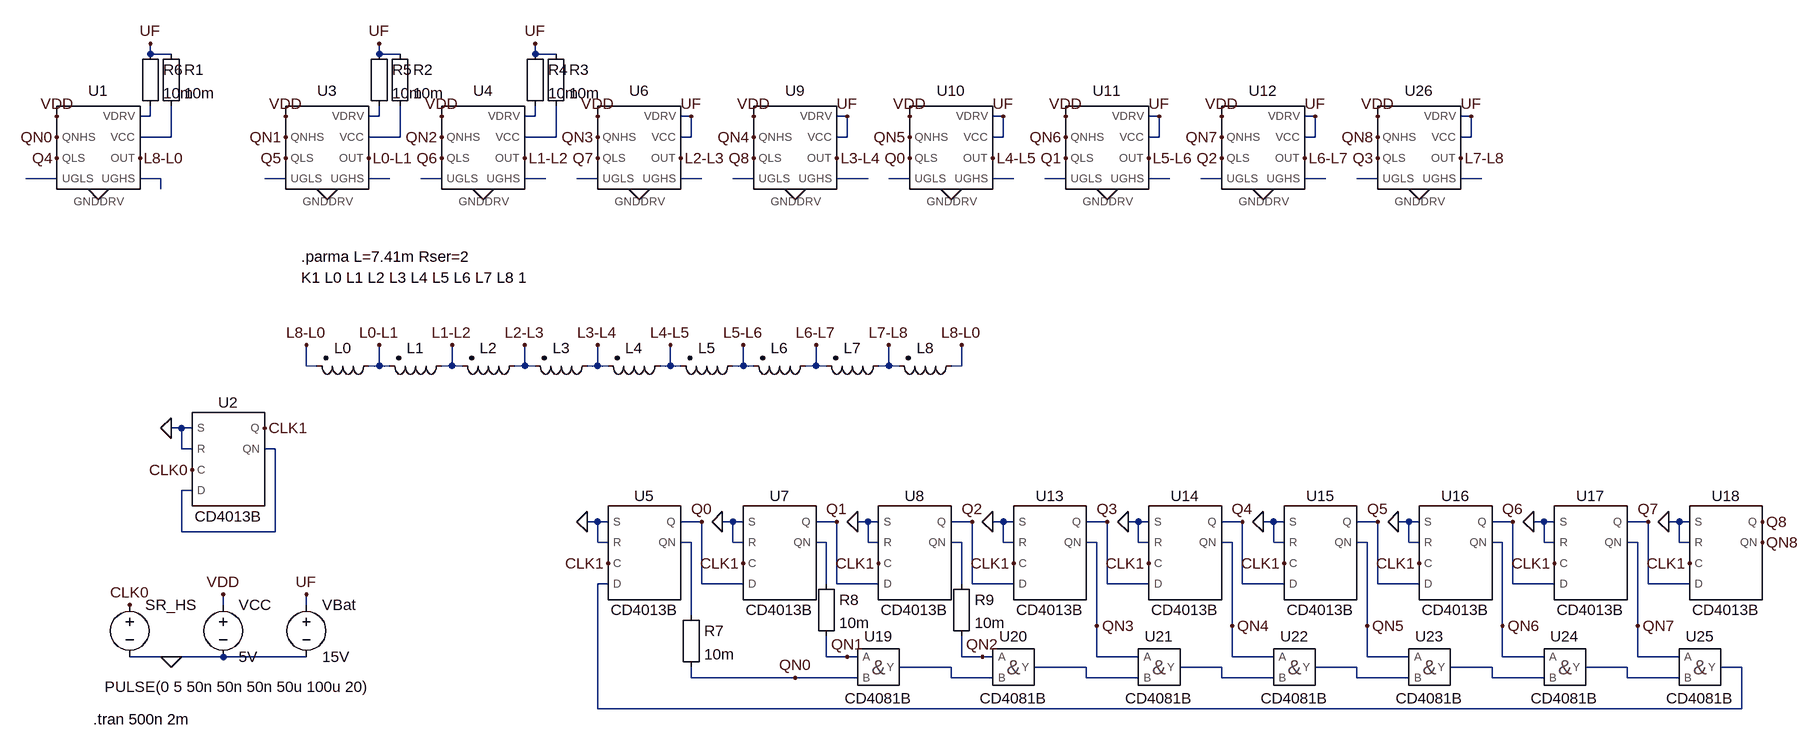
[diagram p0: schematic MosFetDriverDelayedOffPChannelDFF.asc]
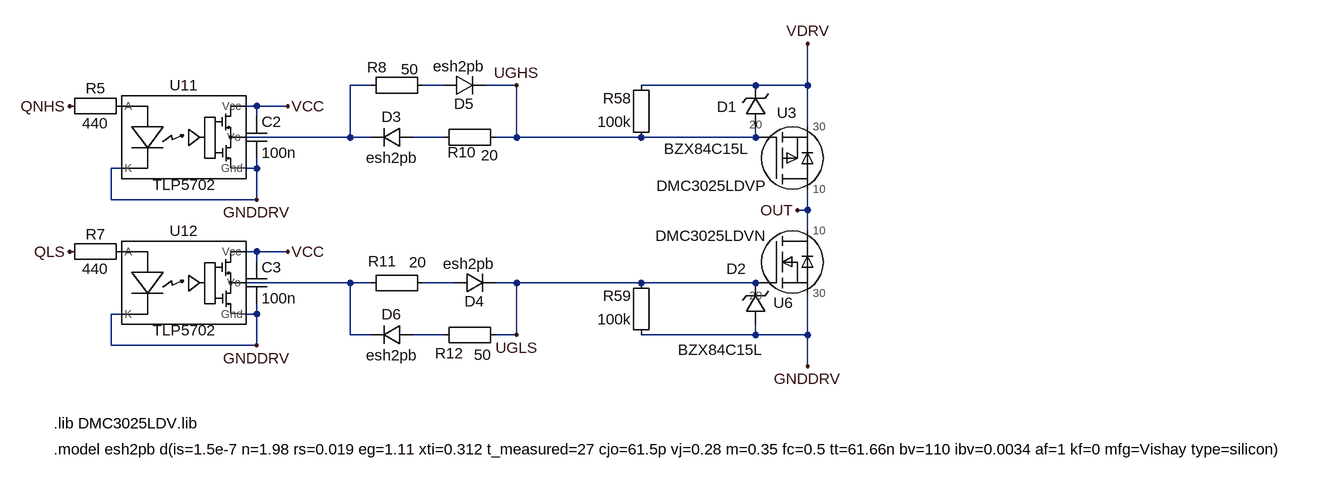
[diagram p1: sub-circuit mosfetdriverblock.asc]
MosFetDriverDelayedOffPChannelDFF.asc, the LTspice schematic file:
Version 4
SHEET 1 3880 2224
WIRE -1856 -160 -1856 -176
WIRE -1824 -160 -1856 -160
WIRE -1504 -160 -1504 -176
WIRE -1472 -160 -1504 -160
WIRE -1264 -160 -1264 -176
WIRE -1232 -160 -1264 -160
WIRE -1856 -64 -1856 -80
WIRE -1856 -64 -1872 -64
WIRE -1504 -64 -1504 -80
WIRE -1504 -64 -1520 -64
WIRE -1264 -64 -1264 -80
WIRE -1264 -64 -1280 -64
WIRE -1024 -64 -1040 -64
WIRE -784 -64 -800 -64
WIRE -544 -64 -560 -64
WIRE -304 -64 -320 -64
WIRE -64 -64 -80 -64
WIRE 176 -64 160 -64
WIRE -1824 -32 -1824 -80
WIRE -1824 -32 -1872 -32
WIRE -1472 -32 -1472 -80
WIRE -1472 -32 -1520 -32
WIRE -1232 -32 -1232 -80
WIRE -1232 -32 -1280 -32
WIRE -1024 -32 -1024 -64
WIRE -1024 -32 -1040 -32
WIRE -784 -32 -784 -64
WIRE -784 -32 -800 -32
WIRE -544 -32 -544 -64
WIRE -544 -32 -560 -32
WIRE -304 -32 -304 -64
WIRE -304 -32 -320 -32
WIRE -64 -32 -64 -64
WIRE -64 -32 -80 -32
WIRE 176 -32 176 -64
WIRE 176 -32 160 -32
WIRE -2000 32 -2048 32
WIRE -1840 32 -1872 32
WIRE -1648 32 -1680 32
WIRE -1488 32 -1520 32
WIRE -1408 32 -1440 32
WIRE -1248 32 -1280 32
WIRE -1168 32 -1200 32
WIRE -1008 32 -1040 32
WIRE -928 32 -960 32
WIRE -752 32 -800 32
WIRE -688 32 -720 32
WIRE -528 32 -560 32
WIRE -448 32 -480 32
WIRE -288 32 -320 32
WIRE -208 32 -240 32
WIRE -48 32 -80 32
WIRE 32 32 0 32
WIRE 192 32 160 32
WIRE -1840 48 -1840 32
WIRE -1616 320 -1616 288
WIRE -1600 320 -1616 320
WIRE -1504 320 -1504 288
WIRE -1504 320 -1520 320
WIRE -1488 320 -1504 320
WIRE -1392 320 -1392 288
WIRE -1392 320 -1408 320
WIRE -1376 320 -1392 320
WIRE -1280 320 -1280 288
WIRE -1280 320 -1296 320
WIRE -1264 320 -1280 320
WIRE -1168 320 -1168 288
WIRE -1168 320 -1184 320
WIRE -1152 320 -1168 320
WIRE -1056 320 -1056 288
WIRE -1056 320 -1072 320
WIRE -1040 320 -1056 320
WIRE -944 320 -944 288
WIRE -944 320 -960 320
WIRE -928 320 -944 320
WIRE -832 320 -832 288
WIRE -832 320 -848 320
WIRE -816 320 -832 320
WIRE -720 320 -720 288
WIRE -720 320 -736 320
WIRE -704 320 -720 320
WIRE -608 320 -608 288
WIRE -608 320 -624 320
WIRE -1808 416 -1824 416
WIRE -1792 416 -1808 416
WIRE -1808 448 -1808 416
WIRE -1792 448 -1808 448
WIRE -1664 448 -1680 448
WIRE -1792 512 -1808 512
WIRE -1168 560 -1184 560
WIRE -1152 560 -1168 560
WIRE -1008 560 -1040 560
WIRE -960 560 -976 560
WIRE -944 560 -960 560
WIRE -800 560 -832 560
WIRE -752 560 -768 560
WIRE -736 560 -752 560
WIRE -592 560 -624 560
WIRE -544 560 -560 560
WIRE -528 560 -544 560
WIRE -384 560 -416 560
WIRE -336 560 -352 560
WIRE -320 560 -336 560
WIRE -176 560 -208 560
WIRE -128 560 -144 560
WIRE -112 560 -128 560
WIRE 32 560 0 560
WIRE 80 560 64 560
WIRE 96 560 80 560
WIRE 240 560 208 560
WIRE 288 560 272 560
WIRE 304 560 288 560
WIRE 448 560 416 560
WIRE 496 560 480 560
WIRE 512 560 496 560
WIRE -1808 576 -1808 512
WIRE -1664 576 -1664 448
WIRE -1664 576 -1808 576
WIRE -1168 592 -1168 560
WIRE -1152 592 -1168 592
WIRE -1024 592 -1040 592
WIRE -960 592 -960 560
WIRE -944 592 -960 592
WIRE -816 592 -832 592
WIRE -752 592 -752 560
WIRE -736 592 -752 592
WIRE -608 592 -624 592
WIRE -544 592 -544 560
WIRE -528 592 -544 592
WIRE -400 592 -416 592
WIRE -336 592 -336 560
WIRE -320 592 -336 592
WIRE -192 592 -208 592
WIRE -128 592 -128 560
WIRE -112 592 -128 592
WIRE 16 592 0 592
WIRE 80 592 80 560
WIRE 96 592 80 592
WIRE 224 592 208 592
WIRE 288 592 288 560
WIRE 304 592 288 592
WIRE 432 592 416 592
WIRE 496 592 496 560
WIRE 512 592 496 592
WIRE -1152 656 -1168 656
WIRE -1008 656 -1008 560
WIRE -944 656 -1008 656
WIRE -816 656 -816 592
WIRE -800 656 -800 560
WIRE -736 656 -800 656
WIRE -608 656 -608 592
WIRE -592 656 -592 560
WIRE -528 656 -592 656
WIRE -384 656 -384 560
WIRE -320 656 -384 656
WIRE -176 656 -176 560
WIRE -112 656 -176 656
WIRE 32 656 32 560
WIRE 96 656 32 656
WIRE 240 656 240 560
WIRE 304 656 240 656
WIRE 448 656 448 560
WIRE 512 656 448 656
WIRE -1744 688 -1744 672
WIRE -1616 688 -1616 672
WIRE -1024 704 -1024 592
WIRE -400 720 -400 592
WIRE -192 720 -192 592
WIRE 16 720 16 592
WIRE 224 720 224 592
WIRE 432 720 432 592
WIRE -1824 768 -1888 768
WIRE -1744 768 -1824 768
WIRE -1616 768 -1744 768
WIRE -816 768 -816 736
WIRE -784 768 -816 768
WIRE -768 768 -784 768
WIRE -608 768 -608 736
WIRE -576 768 -608 768
WIRE -560 768 -576 768
WIRE -400 768 -400 720
WIRE -336 768 -400 768
WIRE -192 768 -192 720
WIRE -128 768 -192 768
WIRE 16 768 16 720
WIRE 80 768 16 768
WIRE 224 768 224 720
WIRE 288 768 224 768
WIRE 432 768 432 720
WIRE 496 768 432 768
WIRE -624 784 -704 784
WIRE -416 784 -496 784
WIRE -208 784 -272 784
WIRE 0 784 -64 784
WIRE 208 784 144 784
WIRE 416 784 352 784
WIRE 592 784 560 784
WIRE -1024 800 -1024 784
WIRE -864 800 -1024 800
WIRE -768 800 -864 800
WIRE -624 800 -624 784
WIRE -560 800 -624 800
WIRE -416 800 -416 784
WIRE -336 800 -416 800
WIRE -208 800 -208 784
WIRE -128 800 -208 800
WIRE 0 800 0 784
WIRE 80 800 0 800
WIRE 208 800 208 784
WIRE 288 800 208 800
WIRE 416 800 416 784
WIRE 496 800 416 800
WIRE -1168 848 -1168 656
WIRE 592 848 592 784
WIRE 592 848 -1168 848
FLAG -1824 768 0
FLAG -1744 672 VDD
FLAG -1888 688 CLK0
FLAG -1792 480 CLK0
FLAG -1824 416 0
FLAG -1680 416 CLK1
FLAG -1184 560 0
FLAG -1152 624 CLK1
FLAG -976 560 0
FLAG -944 624 CLK1
FLAG -768 560 0
FLAG -736 624 CLK1
FLAG -560 560 0
FLAG -528 624 CLK1
FLAG -352 560 0
FLAG -320 624 CLK1
FLAG -144 560 0
FLAG -112 624 CLK1
FLAG 64 560 0
FLAG 96 624 CLK1
FLAG 272 560 0
FLAG 304 624 CLK1
FLAG 480 560 0
FLAG 512 624 CLK1
FLAG -1008 560 Q0
FLAG -800 560 Q1
FLAG -592 560 Q2
FLAG -384 560 Q3
FLAG -176 560 Q4
FLAG 32 560 Q5
FLAG 240 560 Q6
FLAG 448 560 Q7
FLAG 624 560 Q8
FLAG -1616 672 UF
FLAG -2000 -64 VDD
FLAG -1856 -176 UF
FLAG -1936 48 0
FLAG -2000 -32 QN0
FLAG -2000 0 Q4
FLAG -1872 0 L8-L0
FLAG -1648 -64 VDD
FLAG -1504 -176 UF
FLAG -1584 48 0
FLAG -1648 -32 QN1
FLAG -1648 0 Q5
FLAG -1520 0 L0-L1
FLAG -1344 48 0
FLAG -1408 -64 VDD
FLAG -1264 -176 UF
FLAG -1104 48 0
FLAG -1408 -32 QN2
FLAG -1408 0 Q6
FLAG -1280 0 L1-L2
FLAG -1168 -64 VDD
FLAG -1024 -64 UF
FLAG -1168 -32 QN3
FLAG -1168 0 Q7
FLAG -1040 0 L2-L3
FLAG -864 48 0
FLAG -928 -64 VDD
FLAG -304 -64 UF
FLAG -928 -32 QN4
FLAG -928 0 Q8
FLAG -800 0 L3-L4
FLAG -624 48 0
FLAG -384 48 0
FLAG -688 -64 VDD
FLAG -784 -64 UF
FLAG -544 -64 UF
FLAG -688 -32 QN5
FLAG -688 0 Q0
FLAG -560 0 L4-L5
FLAG -144 48 0
FLAG 96 48 0
FLAG -448 -64 VDD
FLAG -64 -64 UF
FLAG -448 -32 QN6
FLAG -448 0 Q1
FLAG -320 0 L5-L6
FLAG -208 -64 VDD
FLAG 176 -64 UF
FLAG -208 -32 QN7
FLAG -208 0 Q2
FLAG -80 0 L6-L7
FLAG 32 -64 VDD
FLAG 32 -32 QN8
FLAG 32 0 Q3
FLAG 160 0 L7-L8
FLAG -1616 288 L8-L0
FLAG -1504 288 L0-L1
FLAG -1392 288 L1-L2
FLAG -1280 288 L2-L3
FLAG -1168 288 L3-L4
FLAG -1056 288 L4-L5
FLAG -944 288 L5-L6
FLAG -832 288 L6-L7
FLAG -720 288 L7-L8
FLAG -608 288 L8-L0
FLAG -864 800 QN0
FLAG -784 768 QN1
FLAG -576 768 QN2
FLAG -400 720 QN3
FLAG -192 720 QN4
FLAG 16 720 QN5
FLAG 224 720 QN6
FLAG 432 720 QN7
FLAG 624 592 QN8
SYMBOL voltage -1888 672 R0
WINDOW 3 -38 142 Left 2
SYMATTR Value PULSE(0 5 50n 50n 50n 50u 100u 20)
SYMATTR InstName SR_HS
SYMBOL voltage -1616 672 R0
SYMATTR InstName VBat
SYMATTR Value 15V
SYMBOL voltage -1744 672 R0
SYMATTR InstName VCC
SYMATTR Value 5V
SYMBOL CD4013B -1744 464 R0
SYMATTR InstName U2
SYMBOL CD4013B -1104 608 R0
SYMATTR InstName U5
SYMBOL CD4013B -896 608 R0
SYMATTR InstName U7
SYMBOL CD4013B -688 608 R0
SYMATTR InstName U8
SYMBOL CD4013B -480 608 R0
SYMATTR InstName U13
SYMBOL CD4013B -272 608 R0
SYMATTR InstName U14
SYMBOL CD4013B -64 608 R0
SYMATTR InstName U15
SYMBOL CD4013B 144 608 R0
SYMATTR InstName U16
SYMBOL CD4013B 352 608 R0
SYMATTR InstName U17
SYMBOL CD4013B 560 608 R0
SYMATTR InstName U18
SYMBOL CD4081B -736 784 R0
SYMATTR InstName U19
SYMBOL CD4081B -528 784 R0
SYMATTR InstName U20
SYMBOL CD4081B -304 784 R0
SYMATTR InstName U21
SYMBOL CD4081B -96 784 R0
SYMATTR InstName U22
SYMBOL CD4081B 112 784 R0
SYMATTR InstName U23
SYMBOL CD4081B 320 784 R0
SYMATTR InstName U24
SYMBOL CD4081B 528 784 R0
SYMATTR InstName U25
SYMBOL MosFetDriverBlock -1936 -16 R0
SYMATTR InstName U1
SYMBOL MosFetDriverBlock -1584 -16 R0
SYMATTR InstName U3
SYMBOL MosFetDriverBlock -1344 -16 R0
SYMATTR InstName U4
SYMBOL MosFetDriverBlock -1104 -16 R0
SYMATTR InstName U6
SYMBOL MosFetDriverBlock -864 -16 R0
SYMATTR InstName U9
SYMBOL MosFetDriverBlock -624 -16 R0
SYMATTR InstName U10
SYMBOL MosFetDriverBlock -384 -16 R0
SYMATTR InstName U11
SYMBOL MosFetDriverBlock -144 -16 R0
SYMATTR InstName U12
SYMBOL MosFetDriverBlock 96 -16 R0
SYMATTR InstName U26
SYMBOL ind2 -1504 304 R90
WINDOW 0 4 56 VBottom 2
WINDOW 3 32 56 Invisible 2
SYMATTR InstName L0
SYMATTR Value {L}
SYMATTR SpiceLine Rser={Rser}
SYMBOL ind2 -1392 304 R90
WINDOW 0 4 56 VBottom 2
WINDOW 3 32 56 Invisible 2
SYMATTR InstName L1
SYMATTR Value {L}
SYMATTR SpiceLine Rser={Rser}
SYMBOL ind2 -1280 304 R90
WINDOW 0 4 56 VBottom 2
WINDOW 3 32 56 Invisible 2
SYMATTR InstName L2
SYMATTR Value {L}
SYMATTR SpiceLine Rser={Rser}
SYMBOL ind2 -1168 304 R90
WINDOW 0 4 56 VBottom 2
WINDOW 3 32 56 Invisible 2
SYMATTR InstName L3
SYMATTR Value {L}
SYMATTR SpiceLine Rser={Rser}
SYMBOL ind2 -1056 304 R90
WINDOW 0 4 56 VBottom 2
WINDOW 3 32 56 Invisible 2
SYMATTR InstName L4
SYMATTR Value {L}
SYMATTR SpiceLine Rser={Rser}
SYMBOL ind2 -944 304 R90
WINDOW 0 4 56 VBottom 2
WINDOW 3 32 56 Invisible 2
SYMATTR InstName L5
SYMATTR Value {L}
SYMATTR SpiceLine Rser={Rser}
SYMBOL ind2 -832 304 R90
WINDOW 0 4 56 VBottom 2
WINDOW 3 32 56 Invisible 2
SYMATTR InstName L6
SYMATTR Value {L}
SYMATTR SpiceLine Rser={Rser}
SYMBOL ind2 -720 304 R90
WINDOW 0 4 56 VBottom 2
WINDOW 3 32 56 Invisible 2
SYMATTR InstName L7
SYMATTR Value {L}
SYMATTR SpiceLine Rser={Rser}
SYMBOL ind2 -608 304 R90
WINDOW 0 4 56 VBottom 2
WINDOW 3 32 56 Invisible 2
SYMATTR InstName L8
SYMATTR Value {L}
SYMATTR SpiceLine Rser={Rser}
SYMBOL Misc/EuropeanResistor -1840 -176 R0
SYMATTR InstName R1
SYMATTR Value 10m
SYMBOL Misc/EuropeanResistor -1488 -176 R0
SYMATTR InstName R2
SYMATTR Value 10m
SYMBOL Misc/EuropeanResistor -1248 -176 R0
SYMATTR InstName R3
SYMATTR Value 10m
SYMBOL Misc/EuropeanResistor -1280 -176 R0
SYMATTR InstName R4
SYMATTR Value 10m
SYMBOL Misc/EuropeanResistor -1520 -176 R0
SYMATTR InstName R5
SYMATTR Value 10m
SYMBOL Misc/EuropeanResistor -1872 -176 R0
SYMATTR InstName R6
SYMATTR Value 10m
SYMBOL Misc/EuropeanResistor -1040 688 R0
SYMATTR InstName R7
SYMATTR Value 10m
SYMBOL Misc/EuropeanResistor -832 640 R0
SYMATTR InstName R8
SYMATTR Value 10m
SYMBOL Misc/EuropeanResistor -624 640 R0
SYMATTR InstName R9
SYMATTR Value 10m
TEXT -1944 864 Left 2 !.tran 500n 2m
TEXT -1624 184 Left 2 !K1 L0 L1 L2 L3 L4 L5 L6 L7 L8 1
TEXT -1624 152 Left 2 !.parma L=7.41m Rser=2

mosfetdriverblock.asc, the sub-circuit schematic file:
Version 4
SHEET 1 3880 2224
WIRE -1040 -224 -1072 -224
WIRE -928 -224 -960 -224
WIRE -816 -224 -864 -224
WIRE -448 -224 -624 -224
WIRE -368 -224 -368 -288
WIRE -368 -224 -448 -224
WIRE -1216 -192 -1232 -192
WIRE -1168 -192 -1216 -192
WIRE -1216 -176 -1216 -192
WIRE -368 -160 -368 -224
WIRE -1072 -144 -1072 -224
WIRE -1072 -144 -1232 -144
WIRE -1040 -144 -1072 -144
WIRE -928 -144 -976 -144
WIRE -816 -144 -816 -224
WIRE -816 -144 -848 -144
WIRE -624 -144 -816 -144
WIRE -448 -144 -448 -160
WIRE -448 -144 -624 -144
WIRE -1424 -96 -1440 -96
WIRE -1216 -96 -1216 -112
WIRE -1216 -96 -1232 -96
WIRE -1440 -48 -1440 -96
WIRE -1216 -48 -1216 -96
WIRE -1216 -48 -1440 -48
WIRE -368 -32 -368 -64
WIRE -368 -32 -384 -32
WIRE -368 0 -368 -32
WIRE -1216 32 -1232 32
WIRE -1168 32 -1216 32
WIRE -1216 48 -1216 32
WIRE -1072 80 -1232 80
WIRE -1040 80 -1072 80
WIRE -912 80 -960 80
WIRE -816 80 -848 80
WIRE -624 80 -816 80
WIRE -448 80 -624 80
WIRE -1424 128 -1440 128
WIRE -1216 128 -1216 112
WIRE -1216 128 -1232 128
WIRE -1072 160 -1072 80
WIRE -1040 160 -1072 160
WIRE -928 160 -976 160
WIRE -816 160 -816 80
WIRE -816 160 -848 160
WIRE -448 160 -448 144
WIRE -448 160 -624 160
WIRE -368 160 -368 96
WIRE -368 160 -448 160
WIRE -1440 176 -1440 128
WIRE -1216 176 -1216 128
WIRE -1216 176 -1440 176
WIRE -368 208 -368 160
FLAG -1168 -192 VCC
FLAG -1168 32 VCC
FLAG -368 -288 VDRV
FLAG -1504 -192 QNHS
FLAG -1504 32 QLS
FLAG -384 -32 OUT
FLAG -368 208 GNDDRV
FLAG -1216 -48 GNDDRV
FLAG -1216 176 GNDDRV
FLAG -816 -224 UGHS
FLAG -816 160 UGLS
SYMBOL Misc/EuropeanResistor -1520 -176 R270
WINDOW 0 28 56 VTop 2
WINDOW 3 5 56 VBottom 2
SYMATTR InstName R5
SYMATTR Value 440
SYMBOL Misc/EuropeanResistor -1520 48 R270
WINDOW 0 27 56 VTop 2
WINDOW 3 5 56 VBottom 2
SYMATTR InstName R7
SYMATTR Value 440
SYMBOL DMP3008SFGQ -400 -112 R0
WINDOW 0 0 -54 Bottom 2
WINDOW 3 -115 27 Top 2
SYMATTR InstName U3
SYMATTR Value DMC3025LDVP
SYMBOL DMN3018SFGQ -384 48 R0
WINDOW 0 -21 78 Bottom 2
WINDOW 3 -132 -56 Top 2
SYMATTR InstName U6
SYMATTR Value DMC3025LDVN
SYMBOL diode -976 -160 R90
WINDOW 0 0 32 VBottom 2
WINDOW 3 32 32 VTop 2
SYMATTR InstName D3
SYMATTR Value esh2pb
SYMBOL TLP5702 -1328 -144 R0
SYMATTR InstName U11
SYMBOL TLP5702 -1328 80 R0
SYMATTR InstName U12
SYMBOL Misc/EuropeanResistor -944 -240 R90
WINDOW 0 4 87 VBottom 2
WINDOW 3 -24 36 VTop 2
SYMATTR InstName R8
SYMATTR Value 50
SYMBOL Misc/EuropeanResistor -832 -160 R90
WINDOW 0 55 68 VBottom 2
WINDOW 3 28 25 VTop 2
SYMATTR InstName R10
SYMATTR Value 20
SYMBOL diode -912 96 R270
WINDOW 0 -28 31 VTop 2
WINDOW 3 61 23 VBottom 2
SYMATTR InstName D4
SYMATTR Value esh2pb
SYMBOL Misc/EuropeanResistor -944 64 R90
WINDOW 0 -2 78 VBottom 2
WINDOW 3 -31 24 VTop 2
SYMATTR InstName R11
SYMATTR Value 20
SYMBOL Misc/EuropeanResistor -832 144 R90
WINDOW 0 60 87 VBottom 2
WINDOW 3 31 36 VTop 2
SYMATTR InstName R12
SYMATTR Value 50
SYMBOL cap -1232 -176 R0
SYMATTR InstName C2
SYMATTR Value 100n
SYMBOL cap -1232 48 R0
SYMATTR InstName C3
SYMATTR Value 100n
SYMBOL Misc/EuropeanResistor -608 -128 R180
WINDOW 0 31 76 Left 2
WINDOW 3 31 40 Left 2
SYMATTR InstName R58
SYMATTR Value 100k
SYMBOL Misc/EuropeanResistor -608 176 R180
WINDOW 0 31 76 Left 2
WINDOW 3 31 40 Left 2
SYMATTR InstName R59
SYMATTR Value 100k
SYMBOL zener -432 -160 R180
WINDOW 0 45 31 Left 2
WINDOW 3 26 -34 Left 2
SYMATTR InstName D1
SYMATTR Value BZX84C15L
SYMBOL zener -432 144 R180
WINDOW 0 30 86 Left 2
WINDOW 3 4 -39 Left 2
SYMATTR InstName D2
SYMATTR Value BZX84C15L
SYMBOL diode -928 -208 R270
WINDOW 0 -28 31 VTop 2
WINDOW 3 61 23 VBottom 2
SYMATTR InstName D5
SYMATTR Value esh2pb
SYMBOL diode -976 144 R90
WINDOW 0 0 32 VBottom 2
WINDOW 3 32 32 VTop 2
SYMATTR InstName D6
SYMATTR Value esh2pb
TEXT -1528 296 Left 2 !.lib DMC3025LDV.lib
TEXT -1528 336 Left 2 !.model esh2pb d(is=1.5e-7 n=1.98 rs=0.019 eg=1.11 xti=0.312 t_measured=27 cjo=61.5p vj=0.28 m=0.35 fc=0.5 tt=61.66n bv=110 ibv=0.0034 af=1 kf=0 mfg=Vishay type=silicon)

The netlist it stands for:
* MosFetDriverDelayedOffPChannelDFF.asc
V§SR_HS CLK0 0 PULSE(0 5 50n 50n 50n 50u 100u 20)
VBat UF 0 15V
VCC VDD 0 5V
XU2 0 CLK0 N025 0 CLK1 N025 VDD 0 CD4013B VDD=5.0 SPEED=0.1 TRIPDT=1e-9  ; pins S C D R Q QN
XU5 0 CLK1 N029 0 Q0 N026 VDD 0 CD4013B VDD=5.0 SPEED=0.1 TRIPDT=1e-9  ; pins S C D R Q QN
XU7 0 CLK1 Q0 0 Q1 N027 VDD 0 CD4013B VDD=5.0 SPEED=0.1 TRIPDT=1e-9  ; pins S C D R Q QN
XU8 0 CLK1 Q1 0 Q2 N028 VDD 0 CD4013B VDD=5.0 SPEED=0.1 TRIPDT=1e-9  ; pins S C D R Q QN
XU13 0 CLK1 Q2 0 Q3 QN3 VDD 0 CD4013B VDD=5.0 SPEED=0.1 TRIPDT=1e-9  ; pins S C D R Q QN
XU14 0 CLK1 Q3 0 Q4 QN4 VDD 0 CD4013B VDD=5.0 SPEED=0.1 TRIPDT=1e-9  ; pins S C D R Q QN
XU15 0 CLK1 Q4 0 Q5 QN5 VDD 0 CD4013B VDD=5.0 SPEED=0.1 TRIPDT=1e-9  ; pins S C D R Q QN
XU16 0 CLK1 Q5 0 Q6 QN6 VDD 0 CD4013B VDD=5.0 SPEED=0.1 TRIPDT=1e-9  ; pins S C D R Q QN
XU17 0 CLK1 Q6 0 Q7 QN7 VDD 0 CD4013B VDD=5.0 SPEED=0.1 TRIPDT=1e-9  ; pins S C D R Q QN
XU18 0 CLK1 Q7 0 Q8 QN8 VDD 0 CD4013B VDD=5.0 SPEED=0.1 TRIPDT=1e-9  ; pins S C D R Q QN
XU19 QN1 QN0 N030 VDD 0 CD4081B VDD=5.0 SPEED=0.1 TRIPDT=1e-9  ; pins A B Y
XU20 QN2 N030 N031 VDD 0 CD4081B VDD=5.0 SPEED=0.1 TRIPDT=1e-9  ; pins A B Y
XU21 QN3 N031 N032 VDD 0 CD4081B VDD=5.0 SPEED=0.1 TRIPDT=1e-9  ; pins A B Y
XU22 QN4 N032 N033 VDD 0 CD4081B VDD=5.0 SPEED=0.1 TRIPDT=1e-9  ; pins A B Y
XU23 QN5 N033 N034 VDD 0 CD4081B VDD=5.0 SPEED=0.1 TRIPDT=1e-9  ; pins A B Y
XU24 QN6 N034 N035 VDD 0 CD4081B VDD=5.0 SPEED=0.1 TRIPDT=1e-9  ; pins A B Y
XU25 QN7 N035 N029 VDD 0 CD4081B VDD=5.0 SPEED=0.1 TRIPDT=1e-9  ; pins A B Y
XU1 QN0 Q4 N004 N001 0 L8-L0 N008 N007 mosfetdriverblock
XU3 QN1 Q5 N005 N002 0 L0-L1 N010 N009 mosfetdriverblock
XU4 QN2 Q6 N006 N003 0 L1-L2 N012 N011 mosfetdriverblock
XU6 QN3 Q7 UF UF 0 L2-L3 N014 N013 mosfetdriverblock
XU9 QN4 Q8 UF UF 0 L3-L4 N016 N015 mosfetdriverblock
XU10 QN5 Q0 UF UF 0 L4-L5 N018 N017 mosfetdriverblock
XU11 QN6 Q1 UF UF 0 L5-L6 N020 N019 mosfetdriverblock
XU12 QN7 Q2 UF UF 0 L6-L7 N022 N021 mosfetdriverblock
XU26 QN8 Q3 UF UF 0 L7-L8 N024 N023 mosfetdriverblock
L0 L0-L1 L8-L0 {L} Rser={Rser}
L1 L1-L2 L0-L1 {L} Rser={Rser}
L2 L2-L3 L1-L2 {L} Rser={Rser}
L3 L3-L4 L2-L3 {L} Rser={Rser}
L4 L4-L5 L3-L4 {L} Rser={Rser}
L5 L5-L6 L4-L5 {L} Rser={Rser}
L6 L6-L7 L5-L6 {L} Rser={Rser}
L7 L7-L8 L6-L7 {L} Rser={Rser}
L8 L8-L0 L7-L8 {L} Rser={Rser}
R1 UF N004 10m
R2 UF N005 10m
R3 UF N006 10m
R4 UF N003 10m
R5 UF N002 10m
R6 UF N001 10m
R7 N026 QN0 10m
R8 N027 QN1 10m
R9 N028 QN2 10m

* block symbol definitions
.subckt mosfetdriverblock QNHS QLS VCC VDRV GNDDRV OUT UGHS UGLS
R5 QNHS P001 440
R7 QLS P002 440
XU3 OUT UGHS VDRV DMC3025LDVP  ; pins 10 20 30
XU6 OUT UGLS GNDDRV DMC3025LDVN  ; pins 10 20 30
D3 N003 N001 esh2pb
XU11 P001 GNDDRV GNDDRV N001 VCC TLP5702 TLP5702  ; pins A K Gnd Vo Vcc
XU12 P002 GNDDRV GNDDRV N004 VCC TLP5702 TLP5702  ; pins A K Gnd Vo Vcc
R8 N002 N001 50
R10 UGHS N003 20
D4 N005 UGLS esh2pb
R11 N005 N004 20
R12 UGLS N006 50
C2 VCC GNDDRV 100n
C3 VCC GNDDRV 100n
R58 UGHS VDRV 100k
R59 GNDDRV UGLS 100k
D1 UGHS VDRV BZX84C15L
D2 GNDDRV UGLS BZX84C15L
D5 N002 UGHS esh2pb
D6 N006 N004 esh2pb
.lib DMC3025LDV.lib
.model esh2pb d(is=1.5e-7 n=1.98 rs=0.019 eg=1.11 xti=0.312 t_measured=27 cjo=61.5p vj=0.28 m=0.35 fc=0.5 tt=61.66n bv=110 ibv=0.0034 af=1 kf=0 mfg=Vishay type=silicon)
.ends mosfetdriverblock

.model D D
.lib standard.dio
.tran 500n 2m
K1 L0 L1 L2 L3 L4 L5 L6 L7 L8 1
.parma L=7.41m Rser=2
.lib CD4000_v.lib
.lib DMP3008SFGQ.lib
.lib DMN3018SFGQ.lib
.lib TLP5702.mod
.backanno
.end